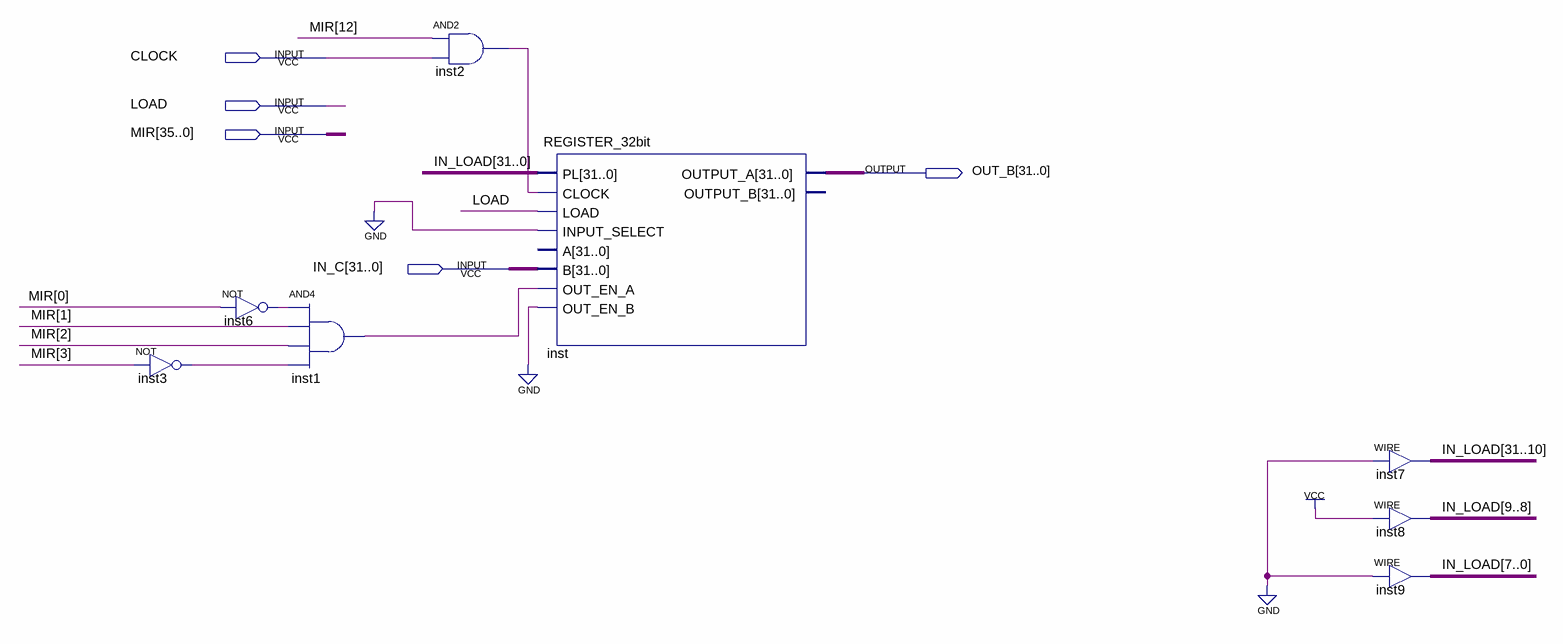
[diagram p0: schematic sheet]
// Quartus schematic CPP.bdf as structural Verilog: 8 symbols, 5 pins
module CPP (
  input  CLOCK,
  input  LOAD,
  input  [35:0] MIR,
  input  [31:0] IN_C,
  output [31:0] OUT_B
);

  wire inst1_out, inst2_out, inst3_out, inst6_out;
  wire [31:0] IN_LOAD;

  not inst3 (inst3_out, MIR[3]);
  not inst6 (inst6_out, MIR[0]);
  and inst1 (inst1_out, inst6_out, MIR[1], MIR[2], inst3_out);
  and inst2 (inst2_out, MIR[12], CLOCK);
  REGISTER_32bit inst (
    .PL(IN_LOAD), .CLOCK(inst2_out), .LOAD(LOAD), .INPUT_SELECT(1'b0), .B(IN_C), .OUT_EN_A(inst1_out),
    .OUT_EN_B(1'b0), .OUTPUT_A(OUT_B));  // open: A, OUTPUT_B
  assign IN_LOAD[31:10] = {22{1'b0}};  // WIRE inst7
  assign IN_LOAD[9:8] = 2'b11;  // WIRE inst8
  assign IN_LOAD[7:0] = {8{1'b0}};  // WIRE inst9
endmodule
